# Altium schematic sheet 01_USB_POWER.SchDoc
size A3; SheetNumber: 2; SheetTotal: 4
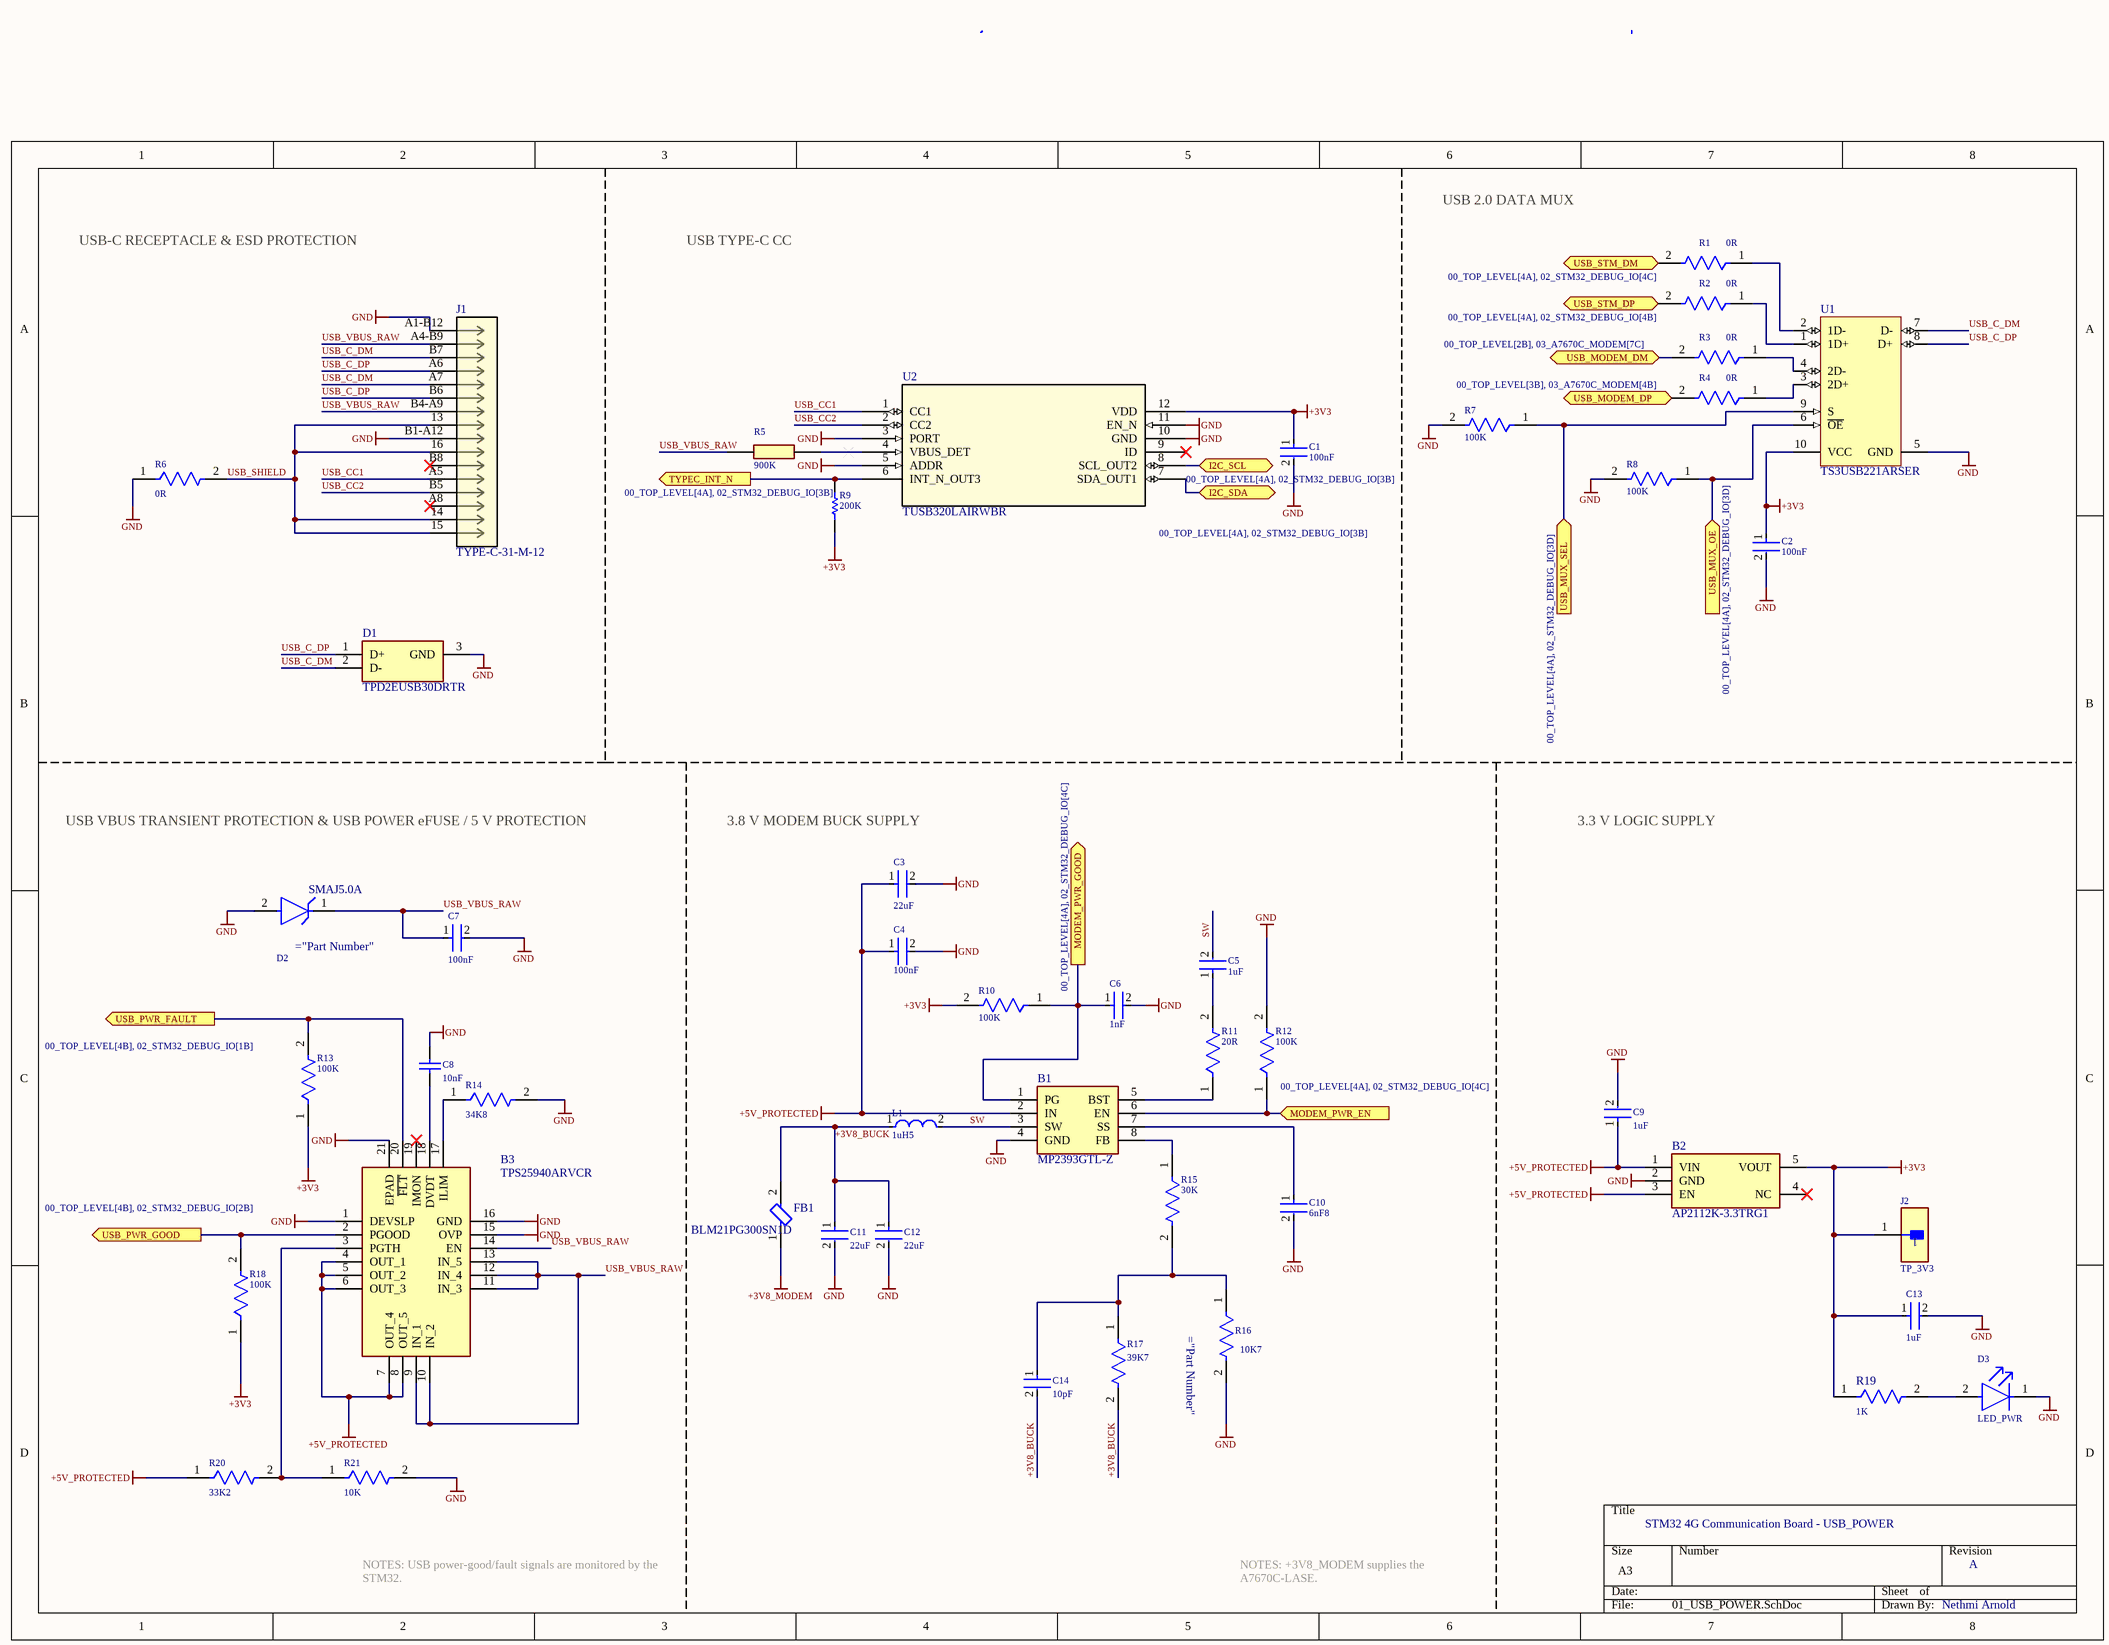
[diagram p0: 01_USB_POWER.SchDoc]

## Parts
B1  MP2393GTL-Z  [SOTFL50P160X60-8N]
B2  AP2112K-3.3TRG1  [SOT95P285X140-5N]
B3  TPS25940ARVCR  [QFN50P300X400X80-21N]
C1  100nF  [FP-CC0402-IPC_C]
C2  100nF  [FP-CC0402-IPC_C]
C3  22uF  [FP-CC0805-0_2-1_45-IPC_B]
C4  100nF  [FP-CC0402-IPC_C]
C5  1uF  [FP-CC0603-DA-IPC_B]
C6  1nF  [FP-C0603C-CF-IPC_B]
C7  100nF  [FP-CC0402-IPC_C]
C8  10nF  [CAPC1608X90X35ML15T15]
C9  1uF  [FP-CC0603-DA-IPC_B]
C10  6nF8  [FP-C0603C-CF-IPC_B]
C11  22uF  [FP-CC0805-0_2-1_45-IPC_B]
C12  22uF  [FP-CC0805-0_2-1_45-IPC_B]
C13  1uF  [FP-CC0603-DA-IPC_B]
C14  10pF  [FP-C0603C-CF-IPC_B]
D1  TPD2EUSB30DRTR  [SOTFL35P100X50-3N]
D2  SMAJ5.0A  [Littelfuse_Inc._SMAJ_0]
D3  LED_PWR  [FP-LTST-C190KGKT-MFG]
FB1  BLM21PG300SN1D  [FP-BLM21-0_2-t0_85-e0_5-d-IPC_B]
J1  TYPE-C-31-M-12  [CONN12_C-31-M-12_HRO]
J2  TP_3V3  [FP-S2751-46R-MFG]
L1  1uH5  [FP-IHLP-2020CZ-FP_1_905x2-MFG]
R1  0R  [FP-CRG0402-IPC_A]
R2  0R  [FP-CRG0402-IPC_A]
R3  0R  [FP-CRG0402-IPC_A]
R4  0R  [FP-CRG0402-IPC_A]
R5  900K  [RESC3116X65N]
R6  0R  [FP-CRG0402-IPC_A]
R7  100K  [FP-CRG0402-IPC_A]
R8  100K  [FP-CRG0402-IPC_A]
R9  200K  [RESC1005X40X25ML10T10]
R10  100K  [FP-CRG0402-IPC_A]
R11  20R  [FP-RT0603-IPC_C]
R12  100K  [FP-CRG0402-IPC_A]
R13  100K  [FP-CRG0402-IPC_A]
R14  34K8  [FP-AF0603-IPC_A]
R15  30K  [FP-AF0603-IPC_A]
R16  10K7  [Yageo_RC0603_IPC_A]
R17  39K7  [FP-RN73R1J-IPC_B]
R18  100K  [FP-CRG0402-IPC_A]
R19  1K  [FP-CRGCQ0603-IPC_C]
R20  33K2  [FP-RT0603-IPC_C]
R21  10K  [FP-AC0603-IPC_C]
U1  TS3USB221ARSER  [RSE0010A_V]
U2  TUSB320LAIRWBR  [RWB0012A_TEX]

## Ports
I2C_SCL (bidir, see 00_TOP_LEVEL[4A], 02_STM32_DEBUG_IO[3B]), I2C_SDA (bidir, see 00_TOP_LEVEL[4A], 02_STM32_DEBUG_IO[3B]), MODEM_PWR_EN (in, see 00_TOP_LEVEL[4A], 02_STM32_DEBUG_IO[4C]), MODEM_PWR_GOOD (out, see 00_TOP_LEVEL[4A], 02_STM32_DEBUG_IO[4C]), TYPEC_INT_N (out, see 00_TOP_LEVEL[4A], 02_STM32_DEBUG_IO[3B]), USB_MODEM_DM (bidir, see 00_TOP_LEVEL[2B], 03_A7670C_MODEM[7C]), USB_MODEM_DP (bidir, see 00_TOP_LEVEL[3B], 03_A7670C_MODEM[4B]), USB_MUX_OE (in, see 00_TOP_LEVEL[4A], 02_STM32_DEBUG_IO[3D]), USB_MUX_SEL (in, see 00_TOP_LEVEL[4A], 02_STM32_DEBUG_IO[3D]), USB_PWR_FAULT (out, see 00_TOP_LEVEL[4B], 02_STM32_DEBUG_IO[1B]), USB_PWR_GOOD (out, see 00_TOP_LEVEL[4B], 02_STM32_DEBUG_IO[2B]), USB_STM_DM (bidir, see 00_TOP_LEVEL[4A], 02_STM32_DEBUG_IO[4C]), USB_STM_DP (bidir, see 00_TOP_LEVEL[4A], 02_STM32_DEBUG_IO[4B])

## Nets
+3V3: B2.5(VOUT) C1.1 C2.1 C13.1 J2.1 R9.2 R10.2 R13.1 R18.1 R19.1 U1.10(VCC) U2.12(VDD)
+3V8_MODEM: FB1.1
+5V_PROTECTED: B1.2(IN) B2.1(VIN) B2.3(EN) B3.4(OUT_1) B3.5(OUT_2) B3.6(OUT_3) B3.7(OUT_4) B3.8(OUT_5) C3.1 C4.1 C9.1 R20.1
GND: B1.4(GND) B2.2(GND) B3.1(DEVSLP) B3.15(OVP) B3.16(GND) B3.21(EPAD) C1.2 C2.2 C3.2 C4.2 C6.2 C7.2 C8.1 C9.2 C10.2 C11.2 C12.2 C13.2 D1.3(GND) D2.2(A) D3.1(C) J1.A1-B12 J1.B1-A12 R6.1 R7.2 R8.2 R12.2 R14.2 R16.2 R21.2 U1.5(GND) U2.3(PORT) U2.5(ADDR) U2.10(GND) U2.11(EN_N)
+3V8_BUCK: C11.1 C12.1 C14.2 FB1.2 L1.1 R17.2
I2C_SCL: U2.8(SCL_OUT2) ; port I2C_SCL
I2C_SDA: U2.7(SDA_OUT1) ; port I2C_SDA
MODEM_PWR_EN: B1.6(EN) R12.1 ; port MODEM_PWR_EN
MODEM_PWR_GOOD: B1.1(PG) C6.1 R10.1 ; port MODEM_PWR_GOOD
SW: B1.3(SW) C5.2 L1.2
TYPEC_INT_N: R9.1 U2.6(INT_N_OUT3) ; port TYPEC_INT_N
USB_C_DM: D1.2(D-) J1.A7 J1.B7 U1.7(D-)
USB_C_DP: D1.1(D+) J1.A6 J1.B6 U1.8(D+)
USB_CC1: J1.A5 U2.1(CC1)
USB_CC2: J1.B5 U2.2(CC2)
USB_MODEM_DM: R3.2 ; port USB_MODEM_DM
USB_MODEM_DP: R4.2 ; port USB_MODEM_DP
USB_MUX_OE: R8.1 U1.6(~{OE}) ; port USB_MUX_OE
USB_MUX_SEL: R7.1 U1.9(S) ; port USB_MUX_SEL
USB_PWR_FAULT: B3.20(~{FLT}) R13.2 ; port USB_PWR_FAULT
USB_PWR_GOOD: B3.2(PGOOD) R18.2 ; port USB_PWR_GOOD
USB_SHIELD: J1.13 J1.14 J1.15 J1.16 R6.2
USB_STM_DM: R1.2 ; port USB_STM_DM
USB_STM_DP: R2.2 ; port USB_STM_DP
USB_VBUS_RAW: B3.9(IN_1) B3.10(IN_2) B3.11(IN_3) B3.12(IN_4) B3.13(IN_5) B3.14(EN) C7.1 D2.1(C) J1.A4-B9 J1.B4-A9 R5.1
NetB1_5: B1.5(BST) R11.1
NetB1_7: B1.7(SS) C10.1
NetB1_8: B1.8(FB) R15.1
NetB3_3: B3.3(PGTH) R20.2 R21.1
NetB3_17: B3.17(ILIM) R14.1
NetB3_18: B3.18(DVDT) C8.2
NetC5_1: C5.1 R11.2
NetC14_1: C14.1 R15.2 R16.1 R17.1
NetD3_2: D3.2(A) R19.2
NetR1_1: R1.1 U1.2(1D-)
NetR2_1: R2.1 U1.1(1D+)
NetR3_1: R3.1 U1.4(2D-)
NetR4_1: R4.1 U1.3(2D+)
NetR5_2: R5.2 U2.4(VBUS_DET)

Not connected (* = marked no-connect by the designer): B2 4(NC)*; B3 19(IMON)*; J1 A8* B8*; U2 9(ID)*

## Notes on the sheet
- USB-C RECEPTACLE & ESD PROTECTION
- USB TYPE-C CC
- USB 2.0 DATA MUX
- USB VBUS TRANSIENT PROTECTION & USB POWER eFUSE / 5 V PROTECTION
- 3.8 V MODEM BUCK SUPPLY
- 3.3 V LOGIC SUPPLY
- STM32 4G Communication Board - USB_POWER
- NOTES: USB power-good/fault signals are monitored by the STM32.
- NOTES: +3V8_MODEM supplies the A7670C-LASE.
- A
- Nethmi Arnold

## Library data of the parts
B1 = MP2393GTL-Z: Converter DC to DC Step-Down 4.2V to 24V 3A 8-Pin SOT-583 T/R; Manufacturer_Name: Monolithic Power Systems (MPS); Geometry.Height: 0.6mm; Manufacturer_Part_Number: MP2393GTL-Z; Mouser Part Number: 946-MP2393GTL-Z; Mouser Price/Stock: https://www.mouser.co.uk/ProductDetail/Monolithic-Power-Systems-MPS/MP2393GTL-Z?qs=YCa%2FAAYMW02wfKsqEy92eA%3D%3D; Arrow Part Number: *; Arrow Price/Stock: *; Datasheet Link: *
B2 = AP2112K-3.3TRG1: 600mA 3.3V LDO Regulator Enable SOT23-5 DiodesZetex AP2112K-3.3TRG1, LDO Voltage Regulator, 3.3 V +/-1.5%, 2.5  6 Vin, 5-Pin SOT-23; Manufacturer_Name: Diodes Incorporated; Geometry.Height: 1.4mm; Manufacturer_Part_Number: AP2112K-3.3TRG1; Mouser Part Number: 621-AP2112K-3.3TRG1; Mouser Price/Stock: https://www.mouser.co.uk/ProductDetail/Diodes-Incorporated/AP2112K-3.3TRG1?qs=x6A8l6qLYDDPYHosCdzh%2FA%3D%3D; Arrow Part Number: AP2112K-3.3TRG1; Arrow Price/Stock: https://www.arrow.com/en/products/ap2112k-3-3trg1/diodes-incorporated.html?utm_currency=USD&region=asia; Datasheet Link: https://www.diodes.com//assets/Datasheets/AP2112.pdf
B3 = TPS25940ARVCR: 18V, 5A, 42m eFuse With Integrated Reverse Current Protection and DevSleep Support; Manufacturer_Name: Texas Instruments; Geometry.Height: 0.8mm; Manufacturer_Part_Number: TPS25940ARVCR; Mouser Part Number: 595-TPS25940ARVCR; Mouser Price/Stock: https://www.mouser.co.uk/ProductDetail/Texas-Instruments/TPS25940ARVCR?qs=1MXlzafEN38UtOFn%252BxDXYg%3D%3D; Arrow Part Number: TPS25940ARVCR; Arrow Price/Stock: https://www.arrow.com/en/products/tps25940arvcr/texas-instruments.html?utm_currency=USD&region=nac; Datasheet Link: http://www.ti.com/lit/ds/symlink/tps25940.pdf
C1 C2 C4 = CMP-03422-000905-1: CC0402MRX5R8BB104  CC0402 100 nF X5R 20.00% 25 V; Manufacturer: YAGEO; Temperature Coefficient: 30ppm/°C; Voltage Rating: 25 V; Tolerance: 0.2; Material: Ceramic; Automotive Grade: NA; Ipc Land Pattern Name: CAPC10050X50; RoHS: TRUE; Value: 100 nF; Footprint Url: http://www.yageo.com/exep/pages/download/literatures/UPY-C_GEN_24.pdf; ComponentLink2URL: http://www.yageo.com/documents/recent/UPY-GP_NP0_16V-to-50V_16.pdf; Device Class L2: Capacitors; Octopart: https://octopart.com/cc0402mrx5r8bb104-yageo-95634517; Device Class L3: Ceramic Capacitors; Capacitance: 100 nF; Temperature: -55°C to +125°C; Package: CC0402; Automotive: No; Temperature Range Low: -55°C; Temperature Range High: +125°C; Lead Free: Yes; Temperature Characteristic: X5R; Category: Cap; Height: 0.55mm; Manufacturer Part Number: CC0402MRX5R8BB104; Device Class L1: Passive Components; ComponentLink2Description: Datasheet
C3 C11 C12 = CMP-03422-001497-1: CAP CER 22UF 25V X5R 0805; Tolerance: 20%; Max Operating Temperature: 85°C; Dielectric: X5R; Termination: SMD/SMT; Voltage Rating: 25V; Width: 0.049inch; Min Operating Temperature: -55°C; Case/Package: 0805; Lead Free: Lead Free; RoHS Compliant: Yes; Weight: 0.000194oz; Voltage Rating (DC): 25V; Capacitance: 22uF; Length: 0.079inch; Halogen Free: Halogen Free; Height: 1.25mm; Packaging: Tape and Reel; Package Quantity: 3000; Case Code (Metric): 2012; Thickness: 0.057inch; Case Code (Imperial): 0805; Mount: Surface Mount
C5 C9 C13 = CMP-03422-000210-1: CAP CER 1UF 6.3V X5R 0603; Manufacturer Part Number: CC0603KRX5R5BB105; Manufacturer: YAGEO; Temperature Coefficient: 15%; Material: Ceramic; Tolerance: 0.1; Temperature: -55°C to +125°C; Footprint Url: http://www.yageo.com/exep/pages/download/literatures/UPY-C_GEN_24.pdf; Value: 1 uF; Lead Free: Yes; Height: 0.9mm; Voltage Rating: 6.3 V; Package: CC0603-DA; Mouser Description: Multilayer Ceramic Capacitors MLCC - SMD/SMT 1uF 6.3V X5R 10%; ComponentLink2URL: http://www.yageo.com/documents/recent/UPY-GPHC_X7R_6.3V-to-50V_18.pdf; Category: Cap; Capacitance: 1 uF; Octopart: https://octopart.com/cc0603krx5r5bb105-yageo-9292796; Voltage: 6.3 V; Automotive: No; Digikey Description: CAP CER 1UF 6.3V X5R 0603; ComponentLink2Description: Datasheet; Device Class L2: Capacitors; Temperature Characteristic: X5R; RoHS: TRUE; Temperature Range High: +125°C; Temperature Range Low: -55°C; Device Class L3: Ceramic Capacitors; Device Class L1: Passive Components
C6 = CMP-2006-03022-3: CAP CER 1000PF 50V X7R 0603; Manufacturer Part Number: C0603C102K5RACTU; Manufacturer: KEMET; Automotive Grade: Grade 1; Tolerance: 0.1; Value: 1,000 pF; Temperature Coefficient: 30ppm/°C; Material: Ceramic; Temperature Characteristic: X7R; ComponentLink2URL: https://api.kemet.com/component-edge/download/datasheet/C0603C100J5GACAUTO.pdf; Temperature Range Low: -55°C; Capacitance: 1,000 pF; Device Class L2: Capacitors; Device Class L3: Ceramic Capacitors; Device Class L1: Passive Components; Temperature Range High: +125°C; Digikey Description: CAP CER 1000PF 50V X7R 0603; Temperature: -55°C to +125°C; Voltage Rating: 50 V; Mouser Description: Capacitor; Ceramic; Cap; 1000pF; Tol 10%; SMT; Vol-Rtg 50V; X7R; Tape and Reel; Automotive: Yes; RoHS: TRUE; Octopart: https://octopart.com/c0603c102k5ractu-kemet-144878; Height: 0.87mm; Package: C0603C-CF; Lead Free: Yes; Category: Cap; ComponentLink2Description: Datasheet
C7 = CMP-03422-000905-1: CC0402 100 nF X5R 20.00% 25 V; Manufacturer: YAGEO; Manufacturer Part Number: CC0402MRX5R8BB104; Temperature Coefficient: 30ppm/°C; Voltage Rating: 25 V; Tolerance: 0.2; Material: Ceramic; Automotive Grade: NA; Ipc Land Pattern Name: CAPC10050X50; RoHS: TRUE; Value: 100 nF; Footprint Url: http://www.yageo.com/exep/pages/download/literatures/UPY-C_GEN_24.pdf; ComponentLink2URL: http://www.yageo.com/documents/recent/UPY-GP_NP0_16V-to-50V_16.pdf; Device Class L2: Capacitors; Octopart: https://octopart.com/cc0402mrx5r8bb104-yageo-95634517; Device Class L3: Ceramic Capacitors; Capacitance: 100 nF; Temperature: -55°C to +125°C; Package: CC0402; Automotive: No; Temperature Range Low: -55°C; Temperature Range High: +125°C; Lead Free: Yes; Temperature Characteristic: X5R; Category: Cap; Height: 0.55mm; Device Class L1: Passive Components; ComponentLink2Description: Datasheet
C8 = CMP-2006-04076-1: Manufacturer: AVX Interconnect / Elco; Part Number: 06031C103MAT2A
C10 = CMP-03020-011393-1: CAP CER 6800PF 50V X7R 0603; Manufacturer Part Number: C0603C682K5RACAUTO; Manufacturer: KEMET; Capacitance: 6,800 pF; Automotive Grade: Grade 1; Material: Ceramic; Value: 6,800 pF; Tolerance: 0.1; Temperature Coefficient: 30ppm/°C; Category: Cap; Temperature Characteristic: X7R; ComponentLink2URL: https://api.kemet.com/component-edge/download/datasheet/C0603C100J5GACAUTO.pdf; Octopart: https://octopart.com/c0603c682k5racauto-kemet-22884307; ComponentLink2Description: Datasheet; Temperature Range High: +125°C; Automotive: Yes; Package: C0603C-CF; Device Class L1: Passive Components; Lead Free: Yes; Device Class L3: Ceramic Capacitors; Temperature: -55°C to +125°C; Height: 0.87mm; Voltage Rating: 50 V; RoHS: TRUE; Device Class L2: Capacitors; Digikey Description: CAP CER 6800PF 50V X7R 0603; Temperature Range Low: -55°C
C14 = CMP-2006-02999-3: CAP CER 10PF 50V C0G/NP0 0603; Manufacturer Part Number: C0603C100J5GACTU; Manufacturer: KEMET; Temperature Coefficient: 30ppm/°C; Temperature Characteristic: C0G; Material: Ceramic; Automotive Grade: Grade 1; Tolerance: 0.05; Device Class L2: Capacitors; Height: 0.87mm; Capacitance: 10 pF; Value: 10 pF; Package: C0603C-CF; Digikey Description: CAP CER 10PF 50V C0G/NP0 0603; Lead Free: Yes; Voltage Rating: 50 V; Mouser Description: Multilayer Ceramic Capacitors MLCC - SMD/SMT 50volts 10pF C0G 5%; Device Class L1: Passive Components; Octopart: https://octopart.com/c0603c100j5gactu-kemet-138281; Category: Cap; Temperature: -55°C to +125°C; ComponentLink2URL: https://api.kemet.com/component-edge/download/datasheet/C0603C100J5GACAUTO.pdf; Temperature Range High: +125°C; ComponentLink2Description: Datasheet; Automotive: Yes; Device Class L3: Ceramic Capacitors; Temperature Range Low: -55°C; RoHS: TRUE
D1 = TPD2EUSB30DRTR: Texas Instruments TPD2EUSB30DRTR Dual Bi-Directional TVS Diode Array, 45W peak, 3-Pin SOT; Geometry.Height: 0.5mm; Manufacturer_Name: Texas Instruments; Manufacturer_Part_Number: TPD2EUSB30DRTR; Mouser Part Number: 595-TPD2EUSB30DRTR; Mouser Price/Stock: https://www.mouser.co.uk/ProductDetail/Texas-Instruments/TPD2EUSB30DRTR?qs=%2Fqzd9s%252BcLd6bPJi5HXCDvw%3D%3D; Arrow Part Number: TPD2EUSB30DRTR; Arrow Price/Stock: https://www.arrow.com/en/products/tpd2eusb30drtr/texas-instruments?utm_currency=USD&region=nac; Datasheet Link: https://datasheet.datasheetarchive.com/originals/distributors/SFDatasheet-11/sf-000234749.pdf
D3 = CMP-2000-05197-2: LED GREEN CLEAR CHIP SMD; Test Current: 20mA; Power Rating: 75mW; Forward Voltage: 2V; Wavelength: 574nm; Number of LEDs: 1; Reverse Voltage: 5V; Dominant Wavelength: 571nm; Lens Style: Diffused; Luminous Intensity: 35mcd; Forward Current: 30mA; Viewing Angle: 130°; Lens Color: Colorless; Width: 0.8mm; Case Code (Imperial): 0603; Case Code (Metric): 1608; Number of Pins: 2; Radiation Hardening: No; Package Quantity: 1; Lead Free: Lead Free; Lens Transparency: Clear; Depth: 0.8mm; Power Dissipation: 75mW; Mount: Surface Mount; Max Operating Temperature: 85°C; Case/Package: 0603; Height: 0.8mm; Illumination Color: Green; Color: Green; Length: 1.6mm; Packaging: Tape and Reel; Number of Elements: 1; Min Operating Temperature: -55°C
FB1 = CMP-0686-00620-3: Chip Ferrite Bead, 0805, 30Ω @ 100MHz, 0.014Ω, , 4A; Tolerance: 25%; Number of Circuits: 1; Impedance: 30R; Max DC Current: 3A; Shielding: Unshielded; Material: Steel; Resistance: 15mR; DC Resistance-Max: 14mR; Series: BLM21P; Military Standard: Not; Max Current Rating: 4A; Termination: SMD/SMT; Length: 2mm; Width: 1.25mm; Test Frequency: 100MHz; Packaging: Tape and Reel; Case/Package: 0805; Current Rating: 4A; Depth: 1.25mm; Package Quantity: 1; REACH SVHC: No SVHC; Core Material: Ferrite; Max Operating Temperature: 125°C; DC Current: 3A; Height: 0.85mm; Frequency: 100MHz; Number of Lines: 1; Case Code (Metric): 2012; Min Operating Temperature: -55°C; Radiation Hardening: No; Case Code (Imperial): 0805; Number of Pins: 2; RoHS Compliant: Yes; DC Resistance (DCR): 14mR; Lead Free: Lead Free
J1 = TYPE-C-31-M-12: Description; Manufacturer_Name: HRO Electronics; Copyright: Copyright (C) 2025 Ultra Librarian. All rights reserved.; Manufacturer_Part_Number: TYPE-C-31-M-12; RefDes: RefDes; Type: Type
J2 = CMP-15817-000010-1: PC TEST POINT NATURAL; Plating: Tin; Body Material: Brass; Color: Natural; Material: Copper Alloy; Mount: Surface Mount; Packaging: Cut Tape
L1 = CMP-02424-000709-1: Fixed Inductors Commercial High Saturation Series 1.5uH 7.2A 20.7mΩ 20%; Max DC Current: 11A; DC Resistance (DCR): 20.7mR; Core Material: Metal; Shielding: Shielded; Test Frequency: 100kHz; Self Resonant Frequency: 5MHz; Length: 5.49mm; Package Quantity: 2000; Height - Seated (Max): 0.118inch; Inductance Tolerance: 20%; Lead Free: Lead Free; Current Rating: 7.2A; Max Operating Temperature: 125°C; Series: IHLP-2020CZ-01; Termination: SMD/SMT; RoHS Compliant: Yes; Width: 5.18mm; Military Standard: Not; Inductance: 1.5uH; Radiation Hardening: No; Case/Package: 2020; Saturation Current: 11A; Packaging: Tape and Reel; RMS Current (Irms): 7.2A; Tolerance: 20%; Depth: 5.43mm; Min Operating Temperature: -55°C; Mount: Surface Mount; Height: 3mm
R1-R4 R6 = CMP-03211-011400-1: CRG0402ZR               RES SMD 0 OHM JUMPER 1/16W 0402; Number of Resistors: 1; Tolerance: 0%; Voltage Rating: 50V; Insulation Resistance: 1GR; Power Rating: 63mW; Temperature Coefficient: 200ppm/°C; Resistance: 0mR; Weight: 2.3E-05oz; Number of Terminations: 2; Technology: THICK FILM; Resistor Type: Thick Film; Mount: Surface Mount; Termination: Solder; Number of Pins: 2; RoHS Compliant: Yes; Packaging: Tape and Reel; Depth: 0.5mm; Case Code (Metric): 1005; Min Operating Temperature: -55°C; Series: CRG; Height: 0.35mm; Voltage Rating (DC): 50V; Case Code (Imperial): 0402; Max Operating Temperature: 125°C; ELV: Compliant; Case/Package: 0402; Length: 1mm; Radiation Hardening: No; Width: 0.5mm; Package Quantity: 10000
R5 = RT1206CRE07900KL: RT1206CRE07900KL 900 kOhms +/-0.25% 0.25W, 1/4W Chip Resistor 1206 (3216 Metric) Thin Film; Manufacturer_Name: Yageo Group; Geometry.Height: 0.65mm; Manufacturer_Part_Number: RT1206CRE07900KL; Mouser Part Number: 603-RT1206CRE07900KL; Mouser Price/Stock: https://www.mouser.co.uk/ProductDetail/YAGEO/RT1206CRE07900KL?qs=NgbZBzc1CyHU6TjGHU7Iqg%3D%3D; Arrow Part Number: RT1206CRE07900KL; Arrow Price/Stock: https://www.arrow.com/en/products/rt1206cre07900kl/yageo?region=nac; Datasheet Link: https://www.yageo.com/upload/media/product/productsearch/datasheet/rchip/PYu-RT_1-to-0.01_RoHS_L_15.pdf
R7 R8 R10 R12 R13 R18 = CMP-03211-011400-1: CRG0402ZR              RES SMD 0 OHM JUMPER 1/16W 0402; Number of Resistors: 1; Tolerance: 0%; Voltage Rating: 50V; Insulation Resistance: 1GR; Power Rating: 63mW; Temperature Coefficient: 200ppm/°C; Resistance: 0mR; Weight: 2.3E-05oz; Number of Terminations: 2; Technology: THICK FILM; Resistor Type: Thick Film; Mount: Surface Mount; Termination: Solder; Number of Pins: 2; RoHS Compliant: Yes; Packaging: Tape and Reel; Depth: 0.5mm; Case Code (Metric): 1005; Min Operating Temperature: -55°C; Series: CRG; Height: 0.35mm; Voltage Rating (DC): 50V; Case Code (Imperial): 0402; Max Operating Temperature: 125°C; ELV: Compliant; Case/Package: 0402; Length: 1mm; Radiation Hardening: No; Width: 0.5mm; Package Quantity: 10000
R9 = CMP-2002-05707-1: Part Number: CRG0402F200K; Manufacturer: TE Connectivity / AMP
R11 = CMP-2000-04685-2: RES SMD 20 OHM 1% 1/10W 0603; Manufacturer Part Number: RT0603FRE0720RL; Manufacturer: Yageo; Temperature Coefficient: 50 ppm/°C; Power Rating: 0.1W; Tolerance: 0.01; Voltage Rating: 75V; Value: 20Ω; Temperature Range High: +155°C; RoHS: TRUE; Mouser Description: Thin Film Resistors - SMD 1/10W 20 ohm 1% 50ppm; Height: 0.55mm; ComponentLink2URL: http://www.yageo.com/documents/recent/PYu-RT_1-to-0.01_RoHS_L_9.pdf; Footprint Url: http://www.yageo.com/exep/pages/download/literatures/PYu-R_Mount_10.pdf; Series: RT; Package: RT0603; ComponentLink2Description: Datasheet; Temperature: -55°C to +155°C; Octopart: https://octopart.com/rt0603fre0720rl-yageo-1374964; Temperature Range Low: -55°C; Lead Free: Yes; Composition: Thin Film; Device Class L2: Resistors; Device Class L1: Passive Components; Device Class L3: Chip SMD Resistors; Digikey Description: RES SMD 20 OHM 1% 1/10W 0603; Resistance: 20Ω; Ipc Land Pattern Name: RESC16080X45; Automotive: No; Category: Res
R14 = CMP-03412-043675-1: Anti-Sulfurated Chip Resistors Automotive Grade 34.8kΩ 1% 100ppm/°C 0603; Max Power Dissipation: 100mW; Resistance: 34.8kR; Number of Terminations: 2; Packaging: Tape and Reel; Height: 0.022inch; Temperature Coefficient: 100ppm/°C; Case/Package: 0603; Tolerance: 1%; Resistor Type: Thick Film; Series: AF; Min Operating Temperature: -55°C; RoHS Compliant: Yes; Features: Moisture Resistant; Width: 0.031inch; Max Operating Temperature: 155°C; Length: 0.063inch
R15 = CMP-03412-046854-1: Anti-Sulfurated Chip Resistors Automotive Grade 30kΩ 1% 100ppm/°C 0603; Resistance: 30kR; Max Power Dissipation: 100mW; Max Operating Temperature: 155°C; Resistor Type: Thick Film; Length: 0.063inch; Packaging: Tape and Reel; Case/Package: 0603; Features: Moisture Resistant; Tolerance: 1%; Temperature Coefficient: 100ppm/°C; RoHS Compliant: Yes; Series: AF; Height: 0.022inch; Number of Terminations: 2; Width: 0.031inch; Min Operating Temperature: -55°C
R16 = RC0603FR-0710K7L
R17 = CMP-04015-046677-1: 39.7kΩ ±0.1% 0.1W, 1/10W Chip Resistor 0603 (1608 Metric) Moisture Resistant Thin Film
R19 = CMP-03211-008566-1: CRGCQ0603 1KΩ 1% ±100ppm/°C 75V; Manufacturer Part Number: CRGCQ0603F1K0; Manufacturer: TE Connectivity; Tolerance: 0.01; Power Rating: 0.1W; Device Class L3: Chip SMD Resistors; Height: 0.55mm; Lead Free: Yes; Value: 1KΩ; ComponentLink2Description: Datasheet; Category: Res; RoHS: TRUE; Series: CRGCQ; Ipc Land Pattern Name: RESC16080X45; Temperature: -55°C to +155°C; Device Class L2: Resistors; Package: CRGCQ0603; Ambient Temperature Range High: +70°C; Octopart: https://octopart.com/crgcq0603f1k0-te+connectivity-91018050; Temperature Range High: +155°C; ComponentLink2URL: https://www.te.com/commerce/DocumentDelivery/DDEController?Action=showdoc&DocId=Data+Sheet%7F1773204-3%7F1%7Fpdf%7FEnglish%7FENG_DS_1773204-3_1.pdf%7F4-2176339-694; Temperature Coefficient: ±100ppm/°C; Voltage Rating: 75V; Composition: Thick Film; Resistance: 1KΩ; Temperature Range Low: -55°C; Device Class L1: Passive Components
R20 = CMP-2000-04729-2: RES SMD 33.2K OHM 1% 1/10W 0603; Manufacturer Part Number: RT0603FRE0733K2L; Manufacturer: Yageo; Resistance: 33.2KΩ; Tolerance: 0.01; Temperature Coefficient: 50 ppm/°C; Power Rating: 0.1W; Voltage Rating: 75V; Value: 33.2KΩ; Temperature Range Low: -55°C; Composition: Thin Film; Temperature Range High: +155°C; Height: 0.55mm; Automotive: No; ComponentLink2Description: Datasheet; Category: Res; Device Class L3: Chip SMD Resistors; Mouser Description: Thin Film Resistors 1/10W 33.2K ohm 1% 50ppm; RoHS: TRUE; Ipc Land Pattern Name: RESC16080X45; Temperature: -55°C to +155°C; Lead Free: Yes; Footprint Url: http://www.yageo.com/exep/pages/download/literatures/PYu-R_Mount_10.pdf; Device Class L2: Resistors; Octopart: https://octopart.com/rt0603fre0733k2l-yageo-1215647; Package: RT0603; Series: RT; Device Class L1: Passive Components; Digikey Description: RES SMD 33.2K OHM 1% 1/10W 0603; ComponentLink2URL: http://www.yageo.com/documents/recent/PYu-RT_1-to-0.01_RoHS_L_9.pdf
R21 = CMP-03412-040683-1: RES 10kΩ 5.00% 0.2W 0603
U1 = TS3USB221ARSER: ESD Protected,High-Speed USB 2.0 (480-Mbps) 1:2 Multiplexer / Demultiplexer Switch, 1:2 Mux / Demux, 6 ohm RON, 2.5 to 3.3V, -40 to 85 degC, 10-Pin UQFN (RSE), Green (RoHS & no Sb/Br); Manufacturer: Texas Instruments; Vcc range(V): 2.3 to 3.6; RON Flatness(Max)(Ohms): 1; ICC(uA): 30; SubFamily: USB Switch; ron(max)(ohms): 6; Number of Channels: 2; Bandwidth(MHz): 900; Architecture: "1","2 mux/demux"; OFF Time(Max)(ns): 12; ESD HBM(kV): +/-7; tpd max(ns): 0.25; RON Mis-match(Max)(Ohms): 0.2; Eco-Plan: Green (RoHS & no Sb/Br); PartNumber: TS3USB221ARSER; ComponentLink1Description: Datasheet; ComponentLink2Description: Package Specification; DatasheetVersion: SCDS277; ComponentLink1URL: http://www.ti.com/general/docs/lit/getliterature.tsp?genericPartNumber=TS3USB221A&fileType=pdf; Code_JEDEC: MO-288-UEFD; ComponentLink2URL: http://www.ti.com/lit/ml/mpqf186c/mpqf186c.pdf; IL OFF(Max)(nA): 2; PackageVersion: revD, Jan-2011; ON Time(Max)(ns): 30; Mounting Technology: Surface Mount; PackageReference: RSE0010A; PackageDescription: 10-Leads Plastic Quad Flatpack No-Lead, 2 x 1.5 x 0.55 mm Body, 0.5 mm Pitch
U2 = TUSB320LAIRWBR: Type-C Configuration Channel Logic and Port Control 12-X2QFN -40 to 85; Manufacturer_Name: Texas Instruments; Copyright: Copyright (C) 2026 Ultra Librarian. All rights reserved.; Manufacturer_Part_Number: TUSB320LAIRWBR; RefDes: RefDes; Type: Type